# Altium schematic sheet FPGA_iCE40HX4K.SchDoc: FPGA iCE40HX4K
size A3; SheetNumber: 6; SheetTotal: 9
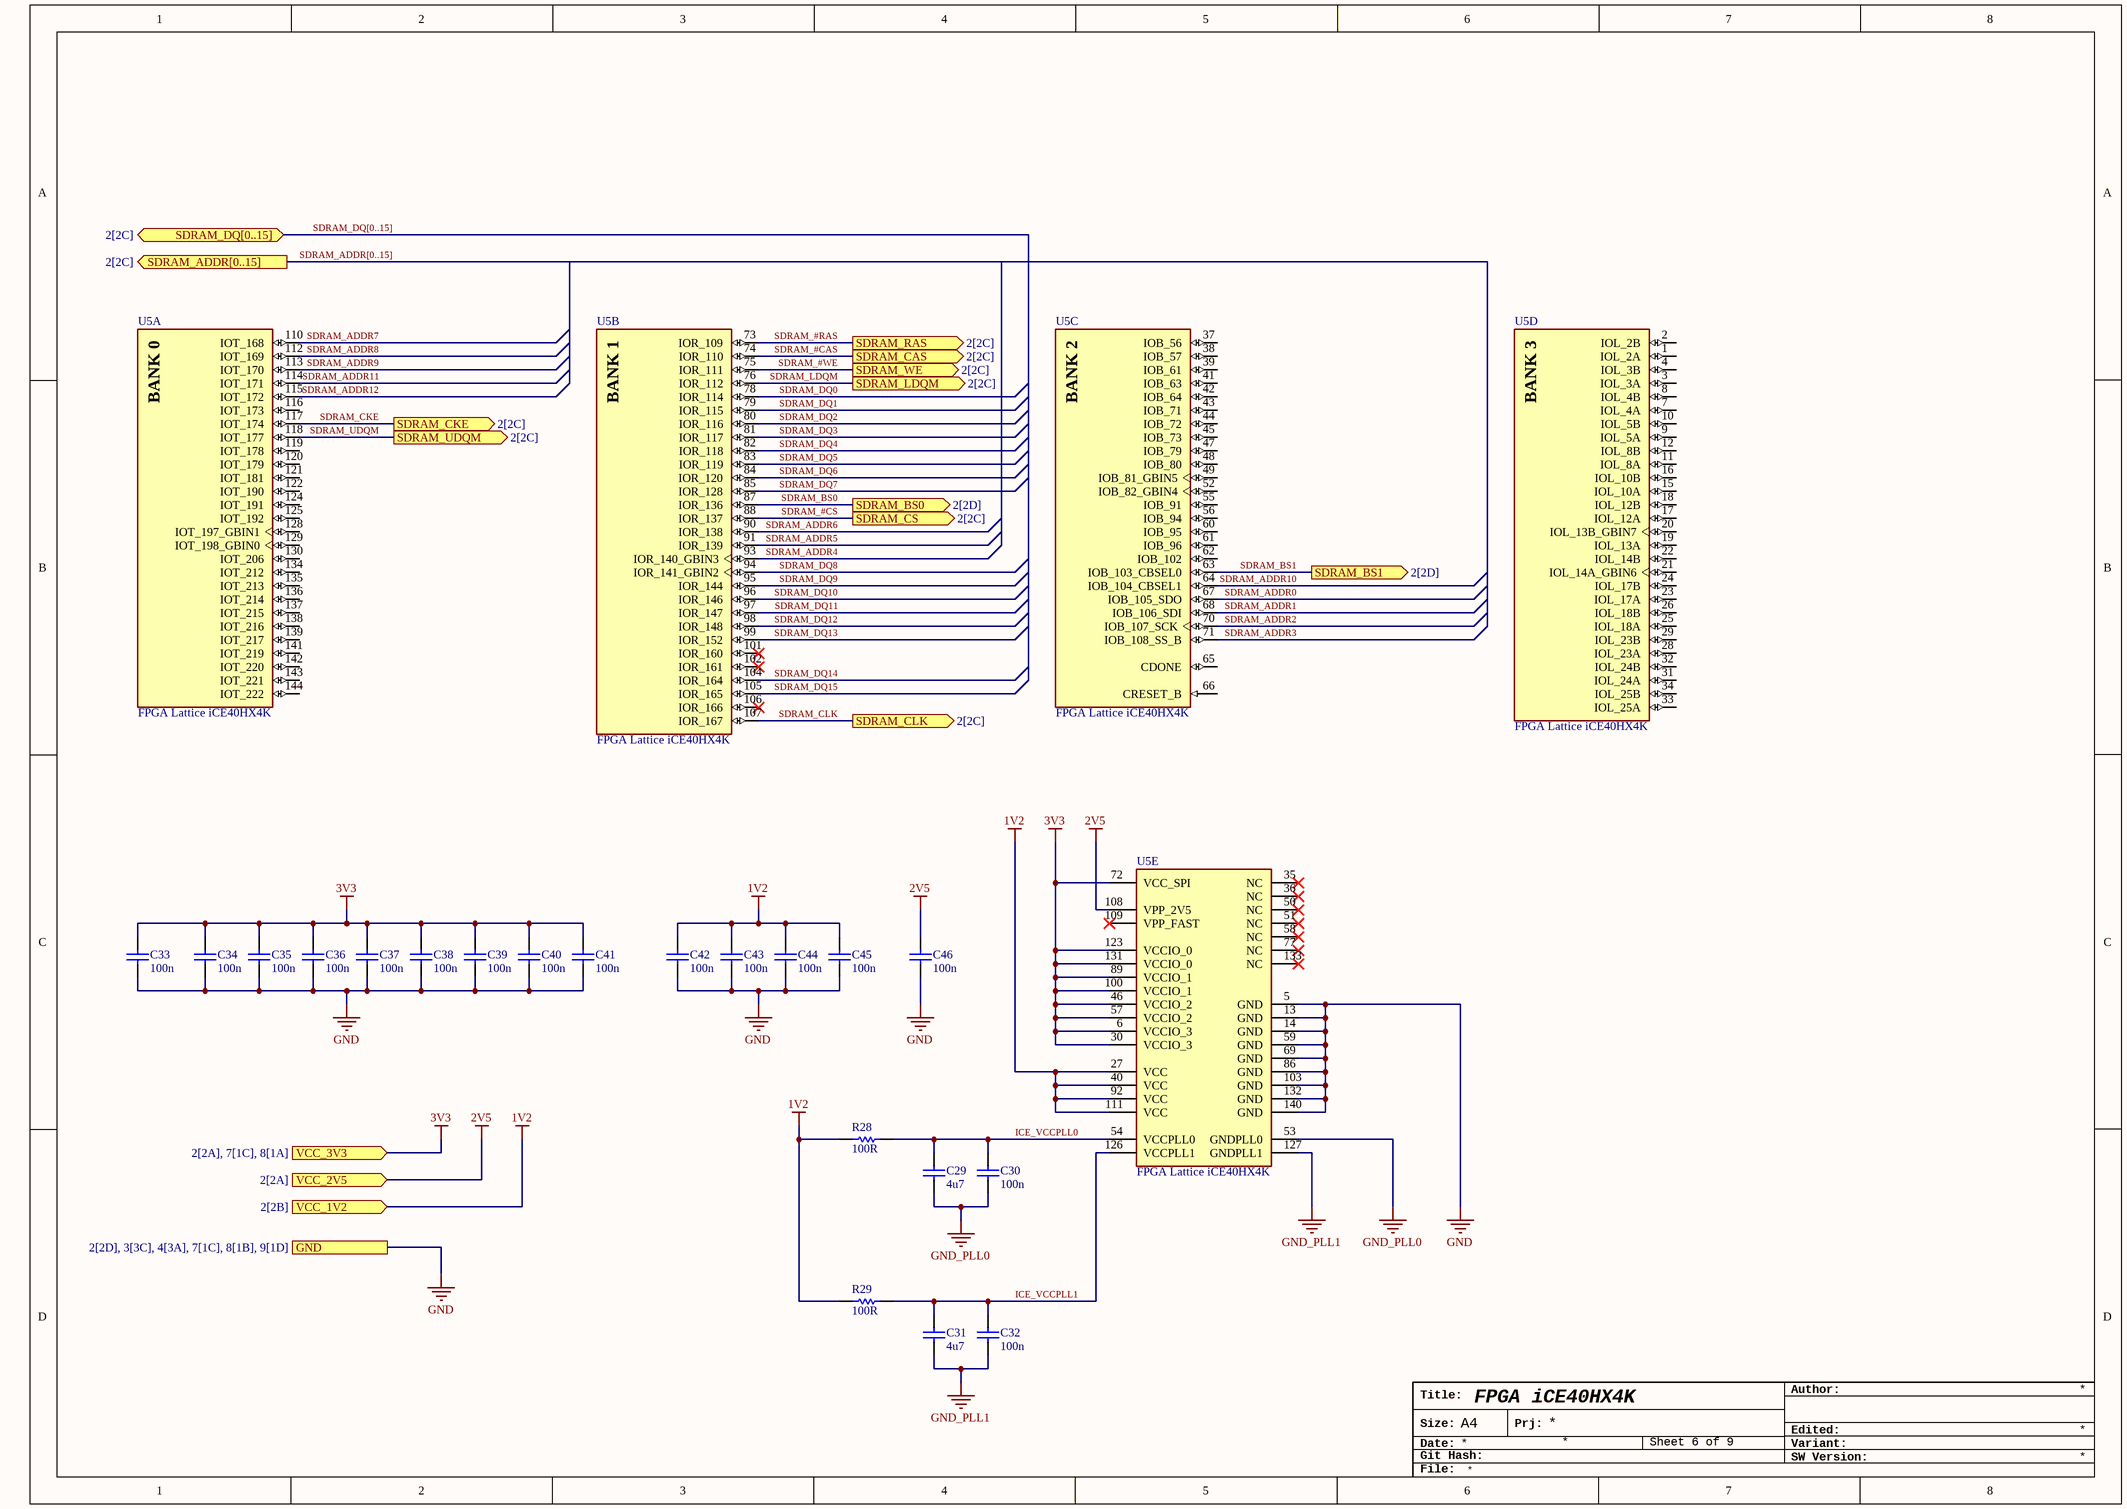
[diagram p0: FPGA_iCE40HX4K.SchDoc]

## Parts
C29  value 4u7  [CAPC1607X09L - 0603]  (hidden comment: 4.7uF 35V)
C30  value 100n  [CAPC1607X09L - 0603]  (hidden comment: 100nF 50V)
C31  value 4u7  [CAPC1607X09L - 0603]  (hidden comment: 4.7uF 35V)
C32  value 100n  [CAPC1607X09L - 0603]  (hidden comment: 100nF 50V)
C33  value 100n  [CAPC1607X09L - 0603]  (hidden comment: 100nF 50V)
C34  value 100n  [CAPC1607X09L - 0603]  (hidden comment: 100nF 50V)
C35  value 100n  [CAPC1607X09L - 0603]  (hidden comment: 100nF 50V)
C36  value 100n  [CAPC1607X09L - 0603]  (hidden comment: 100nF 50V)
C37  value 100n  [CAPC1607X09L - 0603]  (hidden comment: 100nF 50V)
C38  value 100n  [CAPC1607X09L - 0603]  (hidden comment: 100nF 50V)
C39  value 100n  [CAPC1607X09L - 0603]  (hidden comment: 100nF 50V)
C40  value 100n  [CAPC1607X09L - 0603]  (hidden comment: 100nF 50V)
C41  value 100n  [CAPC1607X09L - 0603]  (hidden comment: 100nF 50V)
C42  value 100n  [CAPC1607X09L - 0603]  (hidden comment: 100nF 50V)
C43  value 100n  [CAPC1607X09L - 0603]  (hidden comment: 100nF 50V)
C44  value 100n  [CAPC1607X09L - 0603]  (hidden comment: 100nF 50V)
C45  value 100n  [CAPC1607X09L - 0603]  (hidden comment: 100nF 50V)
C46  value 100n  [CAPC1607X09L - 0603]  (hidden comment: 100nF 50V)
R28  100R  [RESC1508X05L - 0603]
R29  100R  [RESC1508X05L - 0603]
U5  FPGA Lattice iCE40HX4K  [LQFP144_LATTICE]  (parts A,B,C,D,E of 5)

## Ports
GND (see 2[2D], 3[3C], 4[3A], 7[1C], 8[1B], 9[1D]), SDRAM_ADDR[0..15] (out, see 2[2C]), SDRAM_BS0 (out, see 2[2D]), SDRAM_BS1 (out, see 2[2D]), SDRAM_CAS (out, see 2[2C]), SDRAM_CKE (out, see 2[2C]), SDRAM_CLK (out, see 2[2C]), SDRAM_CS (out, see 2[2C]), SDRAM_DQ[0..15] (bidir, see 2[2C]), SDRAM_LDQM (out, see 2[2C]), SDRAM_RAS (out, see 2[2C]), SDRAM_UDQM (out, see 2[2C]), SDRAM_WE (out, see 2[2C]), VCC_1V2 (in, see 2[2B]), VCC_2V5 (in, see 2[2A]), VCC_3V3 (in, see 2[2A], 7[1C], 8[1A])

## Nets
1V2: C42.2 C43.2 C44.2 C45.2 R28.1 R29.1 U5.27(VCC) U5.40(VCC) U5.92(VCC) U5.111(VCC) ; port VCC_1V2
2V5: C46.2 U5.108(VPP_2V5) ; port VCC_2V5
3V3: C33.2 C34.2 C35.2 C36.2 C37.2 C38.2 C39.2 C40.2 C41.2 U5.6(VCCIO_3) U5.30(VCCIO_3) U5.46(VCCIO_2) U5.57(VCCIO_2) U5.72(VCC_SPI) U5.89(VCCIO_1) U5.100(VCCIO_1) U5.123(VCCIO_0) U5.131(VCCIO_0) ; port VCC_3V3
GND: C33.1 C34.1 C35.1 C36.1 C37.1 C38.1 C39.1 C40.1 C41.1 C42.1 C43.1 C44.1 C45.1 C46.1 U5.5(GND) U5.13(GND) U5.14(GND) U5.59(GND) U5.69(GND) U5.86(GND) U5.103(GND) U5.132(GND) U5.140(GND) ; port GND
GND_PLL0: C29.1 C30.1 U5.53(GNDPLL0)
GND_PLL1: C31.1 C32.1 U5.127(GNDPLL1)
ICE_VCCPLL0: C29.2 C30.2 R28.2 U5.54(VCCPLL0)
ICE_VCCPLL1: C31.2 C32.2 R29.2 U5.126(VCCPLL1)
SDRAM_#CAS: U5.74(IOR_110) ; port SDRAM_CAS
SDRAM_#CS: U5.88(IOR_137) ; port SDRAM_CS
SDRAM_#RAS: U5.73(IOR_109) ; port SDRAM_RAS
SDRAM_#WE: U5.75(IOR_111) ; port SDRAM_WE
SDRAM_ADDR0: U5.67(IOB_105_SDO)
SDRAM_ADDR1: U5.68(IOB_106_SDI)
SDRAM_ADDR2: U5.70(IOB_107_SCK)
SDRAM_ADDR3: U5.71(IOB_108_SS_B)
SDRAM_ADDR4: U5.93(IOR_140_GBIN3)
SDRAM_ADDR5: U5.91(IOR_139)
SDRAM_ADDR6: U5.90(IOR_138)
SDRAM_ADDR7: U5.110(IOT_168)
SDRAM_ADDR8: U5.112(IOT_169)
SDRAM_ADDR9: U5.113(IOT_170)
SDRAM_ADDR10: U5.64(IOB_104_CBSEL1)
SDRAM_ADDR11: U5.114(IOT_171)
SDRAM_ADDR12: U5.115(IOT_172)
SDRAM_BS0: U5.87(IOR_136) ; port SDRAM_BS0
SDRAM_BS1: U5.63(IOB_103_CBSEL0) ; port SDRAM_BS1
SDRAM_CKE: U5.117(IOT_174) ; port SDRAM_CKE
SDRAM_CLK: U5.107(IOR_167) ; port SDRAM_CLK
SDRAM_DQ0: U5.78(IOR_114)
SDRAM_DQ1: U5.79(IOR_115)
SDRAM_DQ2: U5.80(IOR_116)
SDRAM_DQ3: U5.81(IOR_117)
SDRAM_DQ4: U5.82(IOR_118)
SDRAM_DQ5: U5.83(IOR_119)
SDRAM_DQ6: U5.84(IOR_120)
SDRAM_DQ7: U5.85(IOR_128)
SDRAM_DQ8: U5.94(IOR_141_GBIN2)
SDRAM_DQ9: U5.95(IOR_144)
SDRAM_DQ10: U5.96(IOR_146)
SDRAM_DQ11: U5.97(IOR_147)
SDRAM_DQ12: U5.98(IOR_148)
SDRAM_DQ13: U5.99(IOR_152)
SDRAM_DQ14: U5.104(IOR_164)
SDRAM_DQ15: U5.105(IOR_165)
SDRAM_LDQM: U5.76(IOR_112) ; port SDRAM_LDQM
SDRAM_UDQM: U5.118(IOT_177) ; port SDRAM_UDQM

Not connected (* = marked no-connect by the designer): U5 1(IOL_2A) 2(IOL_2B) 3(IOL_3A) 4(IOL_3B) 7(IOL_4A) 8(IOL_4B) 9(IOL_5A) 10(IOL_5B) 11(IOL_8A) 12(IOL_8B) 15(IOL_10A) 16(IOL_10B) 17(IOL_12A) 18(IOL_12B) 19(IOL_13A) 20(IOL_13B_GBIN7) 21(IOL_14A_GBIN6) 22(IOL_14B) 23(IOL_17A) 24(IOL_17B) 25(IOL_18A) 26(IOL_18B) 28(IOL_23A) 29(IOL_23B) 31(IOL_24A) 32(IOL_24B) 33(IOL_25A) 34(IOL_25B) 35(NC)* 36(NC)* 37(IOB_56) 38(IOB_57) 39(IOB_61) 41(IOB_63) 42(IOB_64) 43(IOB_71) 44(IOB_72) 45(IOB_73) 47(IOB_79) 48(IOB_80) 49(IOB_81_GBIN5) 50(NC)* 51(NC)* 52(IOB_82_GBIN4) 55(IOB_91) 56(IOB_94) 58(NC)* 60(IOB_95) 61(IOB_96) 62(IOB_102) 65(CDONE) 66(CRESET_B) 77(NC)* 101(IOR_160)* 102(IOR_161)* 106(IOR_166)* 109(VPP_FAST)* 116(IOT_173) 119(IOT_178) 120(IOT_179) 121(IOT_181) 122(IOT_190) 124(IOT_191) 125(IOT_192) 128(IOT_197_GBIN1) 129(IOT_198_GBIN0) 130(IOT_206) 133(NC)* 134(IOT_212) 135(IOT_213) 136(IOT_214) 137(IOT_215) 138(IOT_216) 139(IOT_217) 141(IOT_219) 142(IOT_220) 143(IOT_221) 144(IOT_222)

## Buses and harness runs
bus SDRAM_ADDR[0..15] = port SDRAM_ADDR[0..15]
bus SDRAM_DQ[0..15] = port SDRAM_DQ[0..15]

## Notes on the sheet
- Title:
- Author:
- Size:
- Date:
- Git Hash:
- A4
- Prj:
- SW Version:
- Variant:
- Edited:
- File:
- (in symbol IC-MPN-ICE40HX4K-TQ144, part A) BANK 0
- (in symbol IC-MPN-ICE40HX4K-TQ144, part B) BANK 1
- (in symbol IC-MPN-ICE40HX4K-TQ144, part C) BANK 2
- (in symbol IC-MPN-ICE40HX4K-TQ144, part D) BANK 3

## Library data of the parts
C29 C31 = CAP-0603-4.7uF-35V-X5R: Ceramic capacitor 4.7uF 35V X5R 0603; Supplier 1: DigiKey; Supplier Part Number 1: 490-7205-1-ND
C30 C32-C46 = CAP-0603-100nF-50V-X7R: Ceramic capacitor 100nF 50V X7R 0603; Supplier 1: DigiKey; Supplier Part Number 1: 490-5798-1-ND
R28 R29 = RES-0603-100R-1%: 100R ±1% 0603 100mW 75V; Part Number: 0402WGF1001TCE; Manufacturer: UNI-ROYAL; Supplier 1: DigiKey; Supplier Part Number 1: 311-100HRCT-ND; Value: 100R
U5 = IC-MPN-ICE40HX4K-TQ144: iCE40 HX4K Series FPGA Family, 3520 Logic Cells, 1.2 V Core, 80 K Embedded RAM Bits, TQFP-144; ComponentLink2URL: http://www.latticesemi.com/~/media/Documents/DataSheets/iCE/iCE40LPHXFamilyDataSheet.pdf; ComponentLink1Description: Manufacturer URL; ComponentLink3URL: http://www.latticesemi.com/lit/docs/package/pkg.pdf; ComponentLink3Description: Package Specification; ComponentLink1URL: http://www.latticesemi.com/en; ComponentLink2Description: Datasheet